# Altium project Charger_MOSFET_DaughterCARD_v_1.0.PrjPcb
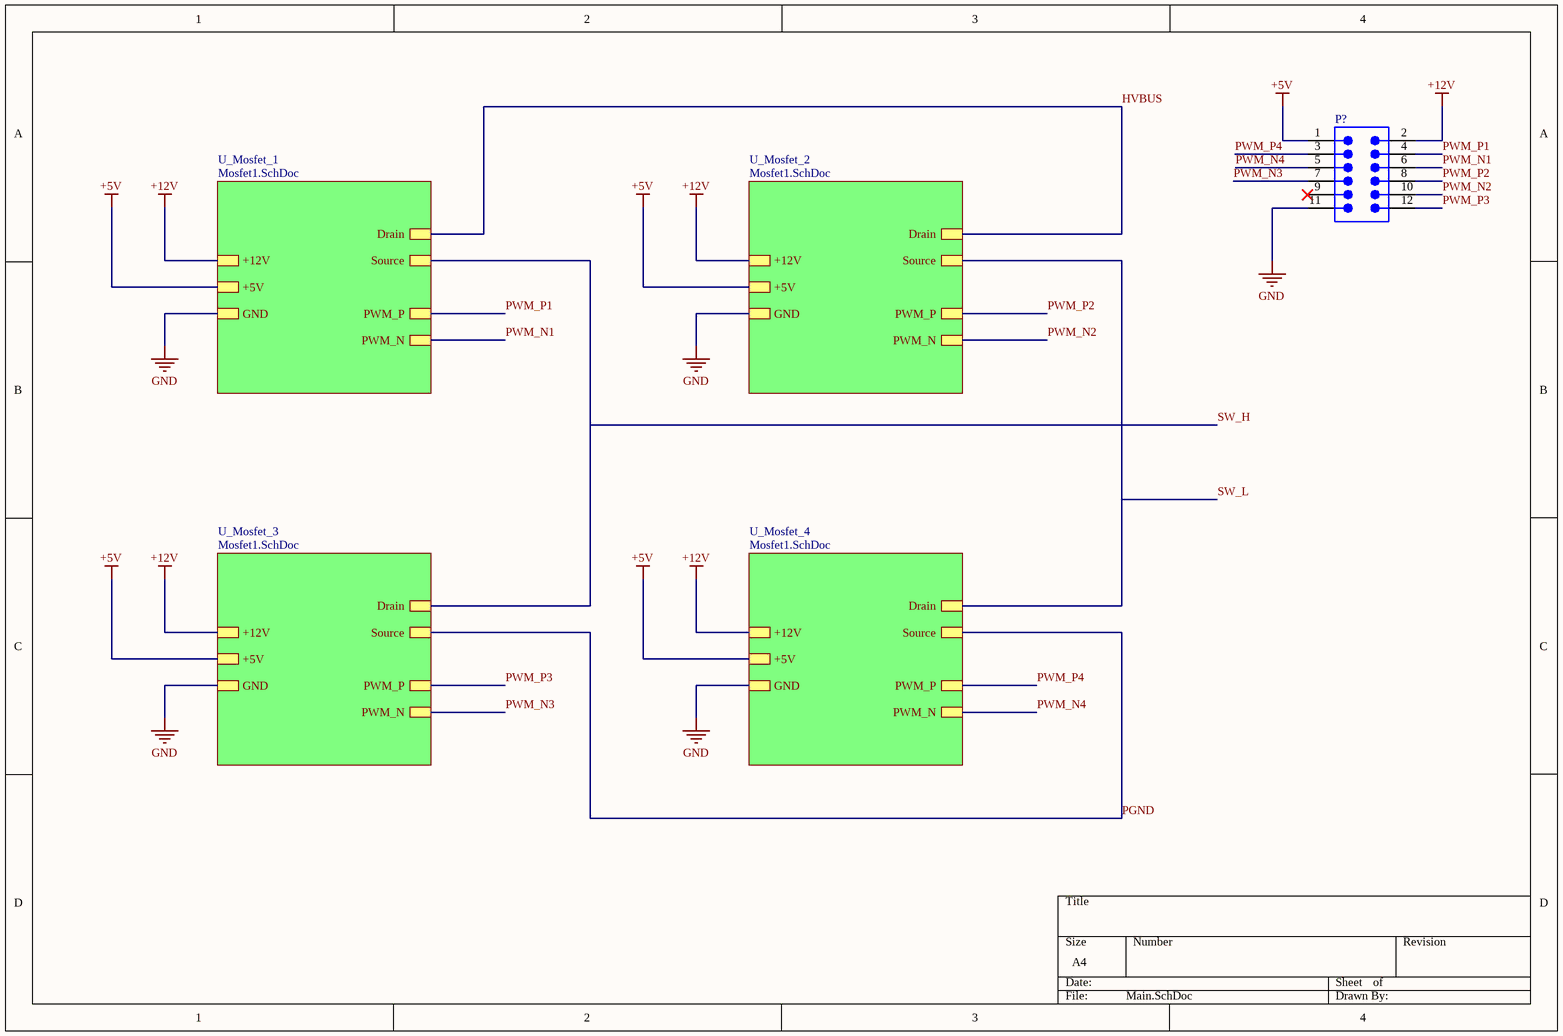
[diagram p0: Main.SchDoc]
2 sheets, 93 parts. Net scope: strictly hierarchical (ports join the sheet entries above them; power ports are local).
Board file: PCB1.PcbDoc
Sheets:
  Main.SchDoc
    U_Mosfet_1 = Mosfet1.SchDoc
    U_Mosfet_2 = Mosfet1.SchDoc
    U_Mosfet_3 = Mosfet1.SchDoc
    U_Mosfet_4 = Mosfet1.SchDoc

## Sheet Main.SchDoc
size A4; SheetNumber: 1; SheetTotal: 3

### Parts
P?  61301221021  [61301221021]  (value not drawn)

### Sub-sheets
U_Mosfet_1 = Mosfet1.SchDoc: Drain, Source, +12V, +5V, GND, PWM_P, PWM_N
U_Mosfet_2 = Mosfet1.SchDoc: Drain, Source, +12V, +5V, GND, PWM_P, PWM_N
U_Mosfet_3 = Mosfet1.SchDoc: Drain, Source, +12V, +5V, GND, PWM_P, PWM_N
U_Mosfet_4 = Mosfet1.SchDoc: Drain, Source, +12V, +5V, GND, PWM_P, PWM_N

### Nets
+5V: P?.1 ; sheet U_Mosfet_1/+5V, sheet U_Mosfet_2/+5V, sheet U_Mosfet_3/+5V, sheet U_Mosfet_4/+5V
+12V: P?.2 ; sheet U_Mosfet_1/+12V, sheet U_Mosfet_2/+12V, sheet U_Mosfet_3/+12V, sheet U_Mosfet_4/+12V
GND: P?.11 ; sheet U_Mosfet_1/GND, sheet U_Mosfet_2/GND, sheet U_Mosfet_3/GND, sheet U_Mosfet_4/GND
HVBUS: sheet U_Mosfet_1/Drain, sheet U_Mosfet_2/Drain  [project net Drain]
PGND: sheet U_Mosfet_3/Source, sheet U_Mosfet_4/Source
PWM_N1: P?.6 ; sheet U_Mosfet_1/PWM_N  [project net PWM_N]
PWM_N2: P?.10 ; sheet U_Mosfet_2/PWM_N  [project net PWM_N]
PWM_N3: P?.7 ; sheet U_Mosfet_3/PWM_N  [project net PWM_N]
PWM_N4: P?.5 ; sheet U_Mosfet_4/PWM_N  [project net PWM_N]
PWM_P1: P?.4 ; sheet U_Mosfet_1/PWM_P  [project net PWM_P]
PWM_P2: P?.8 ; sheet U_Mosfet_2/PWM_P  [project net PWM_P]
PWM_P3: P?.12 ; sheet U_Mosfet_3/PWM_P  [project net PWM_P]
PWM_P4: P?.3 ; sheet U_Mosfet_4/PWM_P  [project net PWM_P]
SW_H: sheet U_Mosfet_1/Source, sheet U_Mosfet_3/Drain  [project net Drain]
SW_L: sheet U_Mosfet_2/Source, sheet U_Mosfet_4/Drain  [project net Drain]

Not connected (* = marked no-connect by the designer): P? 9*

### Library data of the parts
P? = 61301221021: WR-PHD Pin Header, THT, Angled, pitch 2.54mm, 2 Row, 12P; Manufacturer: Wurth Elektronik; Contact Resistance: 20mOhm; Rated Current: 3A; Working Voltage: 250V; Withstanding Voltage: 500V; Manufacturer Part Number: 61301221021; Category: Board-to-Board Connectors; Match Code: WR-PHD; ComponentLink1Description: Website Link; ComponentLink1URL: https://www.we-online.com/redexpert/article/61301221021?ad; ComponentLink2Description: Datasheet Link; ComponentLink2URL: https://www.we-online.com/redexpert/spec/61301221021?ad; Mount: Through Hole; Min Operating Temperature: -40°C; Max Operating Temperature: 105°C; Packaging: Bag; Gender: Pin Header; Number of Pins: 12; Number of Rows: 2; Orientation: Angled; Lead Pitch: 2.54mm

## Sheet Mosfet1.SchDoc
size A4; SheetNumber: 2; SheetTotal: 3; SPICEModelCacheMNIFNTBX: <root> / <DocumentId>MNIFNTBX</DocumentId> / <CacheFrame Number="0"> / <Model Name="6033_7447785006_6.8u" Kind="CKT"> / <Text>******* / .subckt 6033_7447785006_6.8u 1 2 / Rp 1 2 8506.21069778 / Cp 1 2 2.12954534656p / Rs 1 N3 0.079 / L1 N3 2 6.05071959927u / .ends 6033_7447785006_6.8u</Text> / </Model> / <Model Name="0805_150080rs75000" Kind="CKT"> / <Text>****** / .subckt 0805_150080RS75000  1  2 / D1 1 2 SMCW / .MODEL SMCW D / + IS=10.000E-21 / + N=1.6992 / + RS=1.0000E-6 / + IKF=1.2373E-3 / + CJO=1.0000E-12 / + M=.3333 / + VJ=.75 / + BV=5 / + IBV=10.00E-6 / + TT=5.0000E-9 / .ends</Text> / </Model> / <Model Name="1808_8853620100181_220pf" Kind="CKT"> / <Text>******* / .subckt 1808_8853620100181_220pF 1 2 / Rser 1 3 0.0587493769172 / Lser 2 4 0.00000000095 / C1 3 4 0.00000000022 / Rpar 3 4 100000000000 / .ends 1808_8853620100181_220pF</Text> / </Model> / </CacheFrame> / </root>
Used 4 times, as channels U_Mosfet_1, U_Mosfet_2, U_Mosfet_3, U_Mosfet_4. Parts and nets are listed once, with the designators drawn on the sheet.
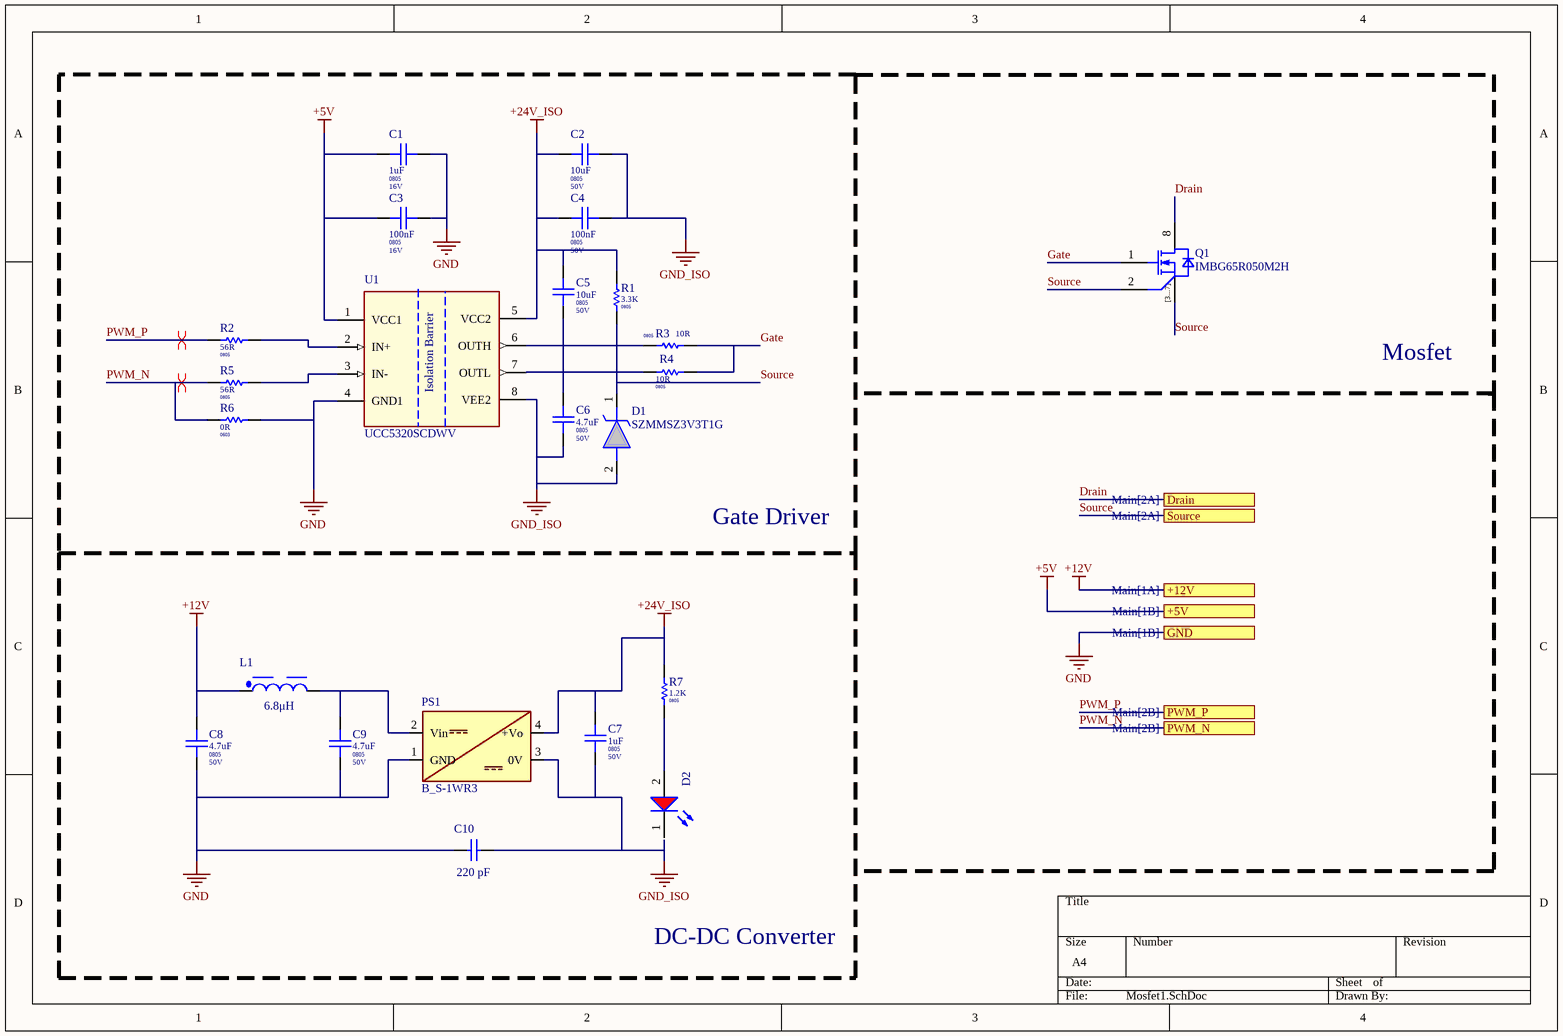
[diagram p1: Mosfet1.SchDoc]

### Parts
C1  Package / Case: 0805  Voltage: 16V  [CAPC 0805]  (hidden comment: 1uF)
C2  Package / Case: 0805  Voltage: 50V  [CAPC 0805]  (hidden comment: 10uF)
C3  Package / Case: 0805  Voltage: 16V  [CAPC 0805]  (hidden comment: 100nF)
C4  Package / Case: 0805  Voltage: 50V  [CAPC 0805]  (hidden comment: 100nF)
C5  Package / Case: 0805  Voltage: 50V  [CAPC 0805]  (hidden comment: 10uF)
C6  Package / Case: 0805  Voltage: 50V  [CAPC 0805]  (hidden comment: 4.7uF)
C7  Package / Case: 0805  Voltage: 50V  [CAPC 0805]  (hidden comment: 1uF)
C8  Package / Case: 0805  Voltage: 50V  [CAPC 0805]  (hidden comment: 4.7uF)
C9  Package / Case: 0805  Voltage: 50V  [CAPC 0805]  (hidden comment: 4.7uF)
C10  220 pF  [WCAP-CSSA_1808_8853620100181]
D1  SZMMSZ3V3T1G  [SOD3716X135N]
D2  Red, 2V, 140°  [WL-SMCW_0805_150080xx75000]  (value not drawn)
L1  6.8μH  [WE-PD_6033R]
PS1  B_S-1WR3  [B_S-1WR3]
Q1  IMBG65R050M2H  [TO127P1500X470-8N-2-V1]
R1  Package / Case: 0805  [RESC 0805]  (hidden comment: 3.3K)
R2  Package / Case: 0805  [RESC 0805]  (hidden comment: 56R)
R3  Package / Case: 0805  [RESC 0805]  (hidden comment: 10R)
R4  Package / Case: 0805  [RESC 0805]  (hidden comment: 10R)
R5  Package / Case: 0805  [RESC 0805]  (hidden comment: 56R)
R6  Package / Case: 0603  [RESC 0603]  (hidden comment: 0R)
R7  Package / Case: 0805  [RESC 0805]  (hidden comment: 1.2K)
U1  UCC5320SCDWV  [DWV0008A]

### Blocks framed on the sheet
Gate Driver: C1-C6 D1 R1-R6 U1

### Ports
+5V (see Main[1B]), +12V (see Main[1A]), Drain (see Main[2A]), GND (see Main[1B]), PWM_N (see Main[2B]), PWM_P (see Main[2B]), Source (see Main[2A])

### Nets
+5V: C1.1 C3.1 U1.1(VCC1) ; port +5V
+12V: C8.2 L1.1 ; port +12V
+24V_ISO: C2.1 C4.1 C5.2 C7.2 PS1.4(+Vo) R1.2 R7.2 U1.5(VCC2)
GND: C1.2 C3.2 C8.1 C9.1 C10.1 PS1.1(GND) R6.1 U1.4(GND1) ; port GND
GND_ISO: C2.2 C4.2 C6.1 C7.1 C10.2 D1.2(A) PS1.3(0V) U1.8(VEE2)
Drain: Q1.8(DRAIN) ; port Drain
Gate: Q1.1(GATE) R3.2 R4.2
PWM_N: R5.1 R6.2 ; port PWM_N
PWM_P: R2.1 ; port PWM_P
Source: D1.1(K) Q1.2(DRIVER_SOURCE) Q1.3(POWER_SOURCE) Q1.4(POWER_SOURCE) Q1.5(POWER_SOURCE) Q1.6(POWER_SOURCE) Q1.7(POWER_SOURCE) R1.1 ; port Source
NetC5_1: C5.1 C6.2
NetC9_2: C9.2 L1.2 PS1.2(Vin)
NetD2_2: D2.2(A) R7.1
NetR2_2: R2.2 U1.2(IN+)
NetR3_1: R3.1 U1.6(OUTH)
NetR4_1: R4.1 U1.7(OUTL)
NetR5_2: R5.2 U1.3(IN-)

Not connected (* = marked no-connect by the designer): D2 1(K)

### Channels
U_Mosfet_1: designators end in _U_Mosfet_1; ports +5V=+5V +12V=+12V Drain=Drain GND=GND PWM_N=PWM_N PWM_P=PWM_P Source=Drain
U_Mosfet_2: designators end in _U_Mosfet_2; ports +5V=+5V +12V=+12V Drain=Drain GND=GND PWM_N=PWM_N PWM_P=PWM_P Source=Drain
U_Mosfet_3: designators end in _U_Mosfet_3; ports +5V=+5V +12V=+12V Drain=Drain GND=GND PWM_N=PWM_N PWM_P=PWM_P Source=PGND
U_Mosfet_4: designators end in _U_Mosfet_4; ports +5V=+5V +12V=+12V Drain=Drain GND=GND PWM_N=PWM_N PWM_P=PWM_P Source=PGND

### Layout directives
differential pair: PWM_N, PWM_P

### Notes on the sheet
- Mosfet
- DC-DC Converter
- (in symbol IMBG65R050M2H) [3...7]
- (in symbol UCC5320SCDWV) Isolation Barrier

### Library data of the parts
C1 = CAPC0709: Capacitor Ceramic 1uF 16V 0805; Tolerance: %10; Value Rating: uF; Values: 1uF 16V; Value: 1uF; Part Number: CAPC0709; Category: Capacitor Ceramic
C2 C5 = CAPC0588: Capacitor Ceramic 10uF 50V 0805; Tolerance: %10; Value Rating: uF; Value: 10uF; Part Number: CAPC0588; Category: Capacitor Ceramic; Values: 10uF 50V
C3 = CAPC0701: Capacitor Ceramic 100nF 16V 0805; Tolerance: %10; Value Rating: nF; Value: 100nF; Part Number: CAPC0701; Category: Capacitor Ceramic; Values: 100nF 16V
C4 = CAPC0572: Capacitor Ceramic 100nF 50V 0805; Tolerance: %10; Value Rating: nF; Favorites: Favorite; Value: 100nF; Part Number: CAPC0572; Category: Capacitor Ceramic; Values: 100nF 50V
C6 C8 C9 = CAPC0584: Capacitor Ceramic 4.7uF 50V 0805; Tolerance: %10; Value Rating: uF; Value: 4.7uF; Part Number: CAPC0584; Category: Capacitor Ceramic; Values: 4.7uF 50V
C7 = CAPC0580: Capacitor Ceramic 1uF 50V 0805; Tolerance: %10; Value Rating: uF; Values: 1uF 50V; Favorites: Favorite; Value: 1uF; Part Number: CAPC0580; Category: Capacitor Ceramic
C10 = 8853620100181: WCAP-CSSA Multilayer Ceramic Chip Safety Capacitor, SMT, size 1808, NP0 Class I, 220 pF, 250 V (AC); Manufacturer: Wurth Elektronik; Case/Size Code: 1808; Capacitance Tolerance: ±5%; Dissipation Factor: 0.1%; Impulse Voltage: 2500 V (DC); Insulation Resistance: 100 GΩ; Safety Class: X2; Manufacturer Part Number: 8853620100181; Category: Multilayer Ceramic Chip Capacitors; Match Code: WCAP-CSSA; ComponentLink1Description: Website Link; ComponentLink1URL: https://www.we-online.com/redexpert/article/8853620100181?ad; ComponentLink2Description: Datasheet Link; ComponentLink2URL: https://www.we-online.com/redexpert/spec/8853620100181?ad; Mount: Surface Mount; Min Operating Temperature: -55 °C; Max Operating Temperature: 125 °C; Packaging: Tape and Reel; Length: 4.5 mm; Width: 2 mm; Height: 2 mm; Capacitance: 220 pF; Ceramic Type: NP0 Class I; Rated Voltage: 250 V (AC)
D1 = SZMMSZ3V3T1G: 500 mW Rating on FR-4 or FR-5 Board; Wide Zener Reverse Voltage Range - 2.4 V to 56 V; Package Designed for Optimal Automated Board Assembly; Small Package Size for High Density Applications; ESD Rating of Class 3 (exceeding 16 kV) per the Human Body Model Mechanical Characteristics:; CASE: Void-free, transfer-molded, thermosetting plastic case; FINISH: Corrosion resistant finish, easily solderable; MAXIMUM CASE TEMPERATURE FOR SOLDERING PURPOSES: 260C for 10 Seconds; POLARITY: Cathode indicated by polarit; Manufacturer_Name: onsemi; Geometry.Height: 1.35mm; Mouser Part Number: 863-SZMMSZ3V3T1G; Mouser Price/Stock: https://www.mouser.co.uk/ProductDetail/onsemi/SZMMSZ3V3T1G?qs=PJJcWtbOkNWDWixFbpUCfA%3D%3D; Manufacturer_Part_Number: SZMMSZ3V3T1G; Datasheet Link: https://www.onsemi.com/pub/Collateral/MMSZ2V4T1-D.PDF
D2 = 150080RS75000: WL-SMCW Mono-color Chip LED Waterclear, SMT, size 0805, Red, 2V, 140°; Manufacturer: Wurth Elektronik; Case/Size Code: 0805; Chip Technology: AlInGaP; Dominant Wavelength: 625nm; Luminous Intensity: 150mcd; Peak Wavelength: 630nm; Manufacturer Part Number: 150080RS75000; Category: Signal LEDs; Match Code: WL-SMCW; ComponentLink1Description: Website Link; ComponentLink1URL: https://www.we-online.com/redexpert/article/150080RS75000?ad; ComponentLink2Description: Datasheet Link; ComponentLink2URL: https://www.we-online.com/redexpert/spec/150080RS75000?ad; Mount: Surface Mount; Min Operating Temperature: -40°C; Max Operating Temperature: 85°C; Packaging: Tape and Reel; Length: 2mm; Width: 1.25mm; Height: 0.7mm; Emitting Color: Red; Forward Voltage: 2V; Viewing Angle: 140°
L1 = 7447785006: WE-PD SMT Power Inductor, size 6033R, 6.8μH, 2.3A, 100mΩ; Manufacturer: Wurth Elektronik; DC Resistance: 79mΩ; Saturation Current: 2A; Self Resonant Frequency: 45MHz; Type: Robust; Manufacturer Part Number: 7447785006; Category: Power Inductors; Match Code: WE-PD; ComponentLink1Description: Website Link; ComponentLink1URL: https://www.we-online.com/redexpert/article/7447785006?ad; ComponentLink2Description: Datasheet Link; ComponentLink2URL: https://www.we-online.com/redexpert/spec/7447785006?ad; Mount: Surface Mount; Min Operating Temperature: -40°C; Max Operating Temperature: 125°C; Packaging: Tape and Reel; Case/Size Code: 6033R; Length: 5.9mm; Width: 6.2mm; Height: 3.3mm; DC Resistance Max: 100mΩ; Inductance: 6.8μH; Rated Current: 2.3A
Q1 = IMBG65R050M2H: Insulated-Gate Field-Effect Transistor (IGFET), N-Channel, Enhancement, Body Diode, Pin 1 Gate, 2 Driver Source, 3 Power Source, 4 Power Source, 5 Power Source, 6 Power Source, 7 Power Source, 8 Drain, 8 Pins; Manufacturer: Infineon Technologies; Manufacturer Order Number: IMBG65R050M2H; PackageReference: PG-TO263-7-12
R1 = R0354: 3.3K 0805; Part Number: R0354; Tolerance: %5; Power: 1/10W; Value: 3.3K; Category: Resistor; Values: 3.3K
R2 R5 = R0312: 56R 0805; Part Number: R0312; Tolerance: %5; Power: 1/10W; Value: 56R; Category: Resistor; Values: 56R
R3 R4 = R0295: 10R 0805; Part Number: R0295; Tolerance: %5; Power: 1/10W; Value: 10R; Category: Resistor; Values: 10R
R6 = R0148: 0R 0603; Part Number: R0148; Tolerance: %5; Power: 1/10W; Value: 0R; Category: Resistor; Values: 0R
R7 = R0344: 1.2K 0805; Part Number: R0344; Tolerance: %5; Power: 1/10W; Value: 1.2K; Category: Resistor; Values: 1.2K
U1 = UCC5320SCDWV: 3k/5kVrms, 2A/2A single-channel isolated gate driver with UVLO referenced to GND or split output 8-SOIC -40 to 125; Manufacturer_Name: Texas Instruments; TYPE: TYPE; RefDes: RefDes; Copyright: Copyright (C) 2025 Ultra Librarian. All rights reserved.; Manufacturer_Part_Number: UCC5320SCDWV; Datasheet: https://www.ti.com/lit/gpn/ucc5320
PS1 = B_S-1WR3: Datasheet_Link: https://www.mornsun-power.com/html/pdf/B1224S-1WR3.html; Supply_Link: https://www.motorobit.com/b1224s-1wr3-dc-dc-1w-108-132v-giris-24v-cikis-voltaj-donusturucu

## Nets that join several sheets
+5V: Main (P?.1), U_Mosfet_1 (C1_U_Mosfet_1.1 C3_U_Mosfet_1.1 U1_U_Mosfet_1.1), U_Mosfet_2 (C1_U_Mosfet_2.1 C3_U_Mosfet_2.1 U1_U_Mosfet_2.1), U_Mosfet_3 (C1_U_Mosfet_3.1 C3_U_Mosfet_3.1 U1_U_Mosfet_3.1), U_Mosfet_4 (C1_U_Mosfet_4.1 C3_U_Mosfet_4.1 U1_U_Mosfet_4.1)
+12V: Main (P?.2), U_Mosfet_1 (C8_U_Mosfet_1.2 L1_U_Mosfet_1.1), U_Mosfet_2 (C8_U_Mosfet_2.2 L1_U_Mosfet_2.1), U_Mosfet_3 (C8_U_Mosfet_3.2 L1_U_Mosfet_3.1), U_Mosfet_4 (C8_U_Mosfet_4.2 L1_U_Mosfet_4.1)
GND: Main (P?.11), U_Mosfet_1 (8 pins), U_Mosfet_2 (8 pins), U_Mosfet_3 (8 pins), U_Mosfet_4 (8 pins)
Drain: U_Mosfet_1 (8 pins), U_Mosfet_3 (Q1_U_Mosfet_3.8)
Drain: U_Mosfet_1 (Q1_U_Mosfet_1.8), U_Mosfet_2 (Q1_U_Mosfet_2.8)
Drain: U_Mosfet_2 (8 pins), U_Mosfet_4 (Q1_U_Mosfet_4.8)
PGND: U_Mosfet_3 (8 pins), U_Mosfet_4 (8 pins)
PWM_N: Main (P?.5), U_Mosfet_4 (R5_U_Mosfet_4.1 R6_U_Mosfet_4.2)
PWM_N: Main (P?.6), U_Mosfet_1 (R5_U_Mosfet_1.1 R6_U_Mosfet_1.2)
PWM_N: Main (P?.7), U_Mosfet_3 (R5_U_Mosfet_3.1 R6_U_Mosfet_3.2)
PWM_N: Main (P?.10), U_Mosfet_2 (R5_U_Mosfet_2.1 R6_U_Mosfet_2.2)
PWM_P: Main (P?.3), U_Mosfet_4 (R2_U_Mosfet_4.1)
PWM_P: Main (P?.4), U_Mosfet_1 (R2_U_Mosfet_1.1)
PWM_P: Main (P?.8), U_Mosfet_2 (R2_U_Mosfet_2.1)
PWM_P: Main (P?.12), U_Mosfet_3 (R2_U_Mosfet_3.1)